# Altium project Pukk-Sensor-Module-v1.0.PrjPcb (part 1 of 6)
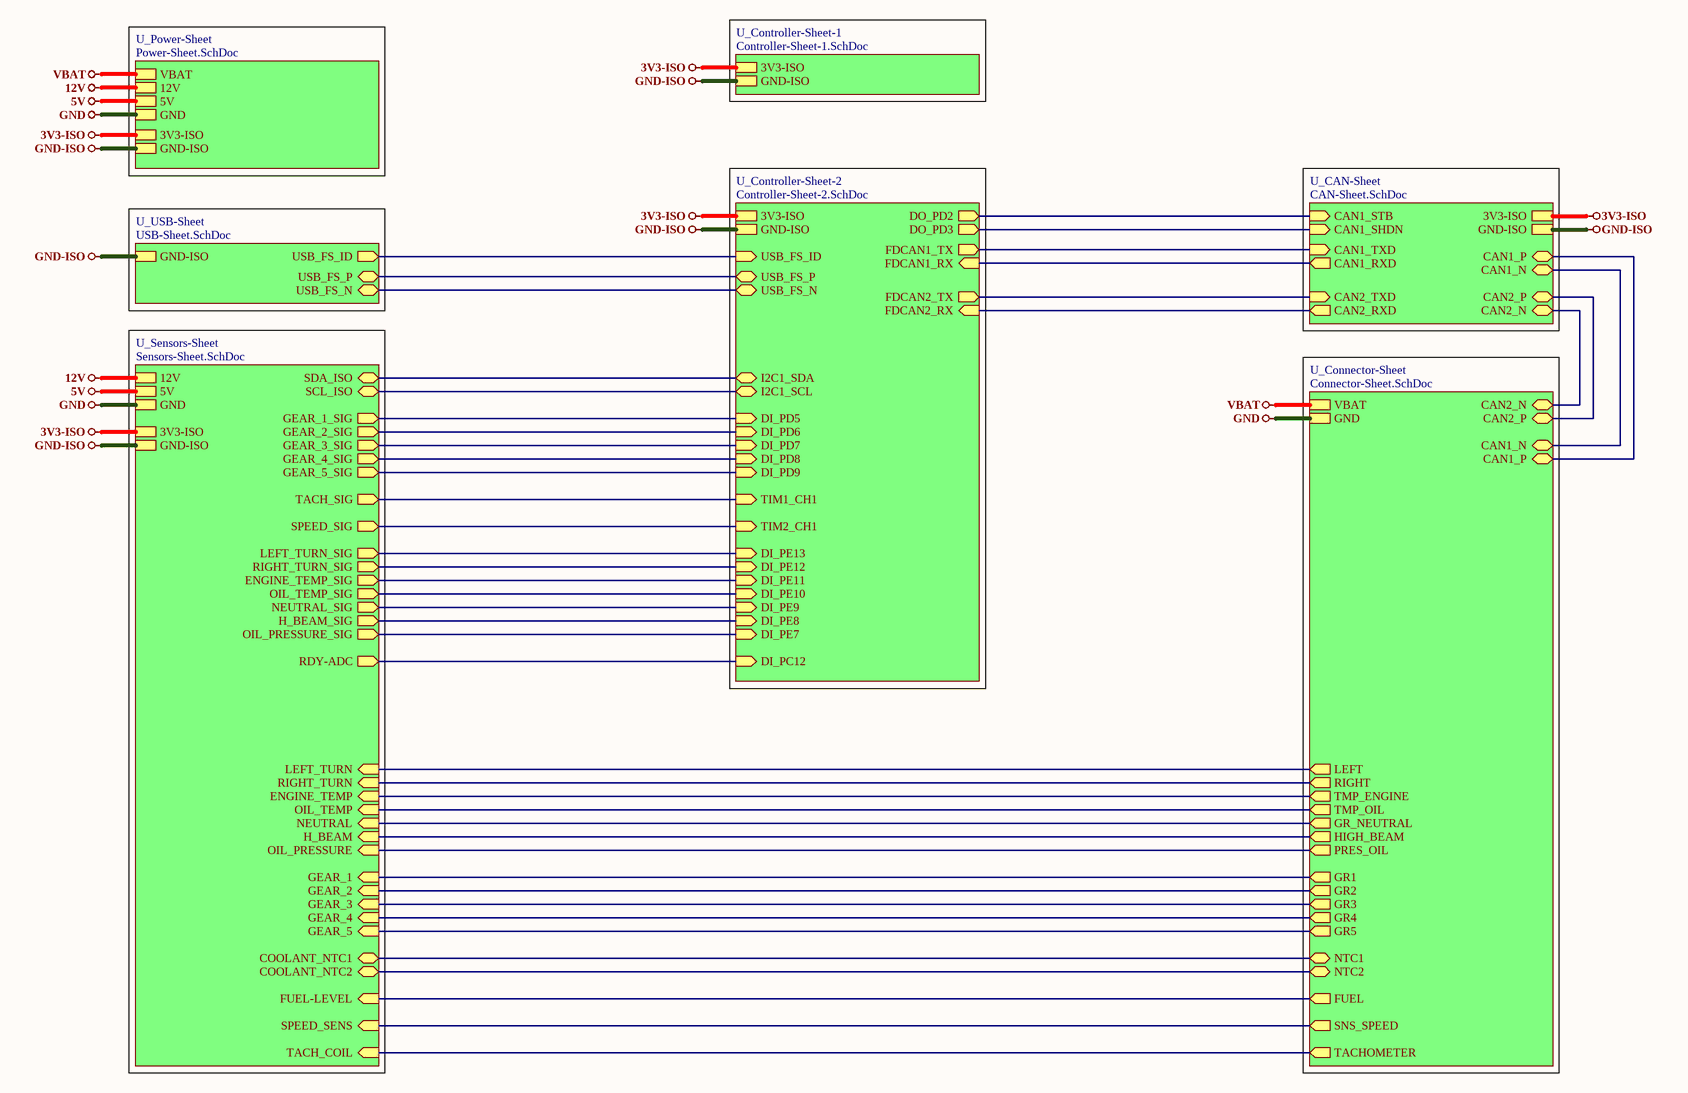
[diagram p0: Top-Sheet.SchDoc]
8 sheets, 261 parts. Net scope: hierarchical (ports join the sheet entries above them; power ports are global).
Board file: Pukk-Sensor-PCB.PcbDoc
Sheets:
  Top-Sheet.SchDoc
    U_Power-Sheet = Power-Sheet.SchDoc
    U_Controller-Sheet-1 = Controller-Sheet-1.SchDoc
    U_Controller-Sheet-2 = Controller-Sheet-2.SchDoc
    U_USB-Sheet = USB-Sheet.SchDoc
    U_CAN-Sheet = CAN-Sheet.SchDoc
    U_Sensors-Sheet = Sensors-Sheet.SchDoc
    U_Connector-Sheet = Connector-Sheet.SchDoc

## Sheet Top-Sheet.SchDoc
size 420 x 297 mm; SheetNumber: 1; SheetTotal: 8

### Sub-sheets
U_CAN-Sheet = CAN-Sheet.SchDoc: CAN1_STB (in), CAN1_TXD (in), CAN1_RXD (out), CAN1_SHDN (in), CAN2_TXD (in), CAN2_RXD (out), 3V3-ISO, GND-ISO, CAN1_P (bidir), CAN1_N (bidir), CAN2_P (bidir), CAN2_N (bidir)
U_Connector-Sheet = Connector-Sheet.SchDoc: GND, VBAT, CAN1_P (bidir), CAN1_N (bidir), CAN2_P (bidir), CAN2_N (bidir), TACHOMETER (out), SNS_SPEED (out), FUEL (out), NTC1 (bidir), NTC2 (bidir), GR1 (out), GR2 (out), GR3 (out), GR4 (out), GR5 (out), LEFT (out), RIGHT (out), TMP_ENGINE (out), TMP_OIL (out), GR_NEUTRAL (out), HIGH_BEAM (out), PRES_OIL (out)
U_Controller-Sheet-1 = Controller-Sheet-1.SchDoc: 3V3-ISO, GND-ISO
U_Controller-Sheet-2 = Controller-Sheet-2.SchDoc: USB_FS_ID (in), USB_FS_N (bidir), USB_FS_P (bidir), FDCAN1_RX (in), FDCAN1_TX (out), FDCAN2_RX (in), FDCAN2_TX (out), DO_PD2 (out), I2C1_SDA (bidir), I2C1_SCL (bidir), DI_PD5 (in), DI_PD6 (in), DI_PD7 (in), DI_PD8 (in), DI_PD9 (in), TIM1_CH1 (in), TIM2_CH1 (in), DI_PC12 (in), DI_PE7 (in), DI_PE8 (in), DI_PE9 (in), DI_PE10 (in), DI_PE11 (in), DI_PE12 (in), DI_PE13 (in), 3V3-ISO, GND-ISO, DO_PD3 (out)
U_Power-Sheet = Power-Sheet.SchDoc: GND, 3V3-ISO, 12V, VBAT, GND-ISO, 5V
U_Sensors-Sheet = Sensors-Sheet.SchDoc: FUEL-LEVEL (in), TACH_COIL (in), TACH_SIG (out), SPEED_SIG (out), SPEED_SENS (in), RDY-ADC (out), LEFT_TURN (in), NEUTRAL (in), RIGHT_TURN (in), H_BEAM (in), OIL_PRESSURE (in), ENGINE_TEMP (in), OIL_TEMP (in), NEUTRAL_SIG (out), LEFT_TURN_SIG (out), RIGHT_TURN_SIG (out), H_BEAM_SIG (out), ENGINE_TEMP_SIG (out), OIL_PRESSURE_SIG (out), OIL_TEMP_SIG (out), GEAR_4 (in), GEAR_5 (in), GEAR_1 (in), GEAR_2 (in), GEAR_3 (in), GEAR_4_SIG (out), GEAR_5_SIG (out), GEAR_1_SIG (out), GEAR_2_SIG (out), GEAR_3_SIG (out), COOLANT_NTC2 (bidir), COOLANT_NTC1 (bidir), GND, 3V3-ISO, 12V, GND-ISO, 5V, SDA_ISO (bidir), SCL_ISO (bidir)
U_USB-Sheet = USB-Sheet.SchDoc: USB_FS_ID (out), USB_FS_N (bidir), USB_FS_P (bidir), GND-ISO

### Nets
3V3-ISO: sheet U_Power-Sheet/3V3-ISO, sheet U_Controller-Sheet-1/3V3-ISO, sheet U_Controller-Sheet-2/3V3-ISO, sheet U_CAN-Sheet/3V3-ISO, sheet U_Sensors-Sheet/3V3-ISO
5V: sheet U_Power-Sheet/5V, sheet U_Sensors-Sheet/5V
12V: sheet U_Power-Sheet/12V, sheet U_Sensors-Sheet/12V
GND: sheet U_Power-Sheet/GND, sheet U_Sensors-Sheet/GND, sheet U_Connector-Sheet/GND
GND-ISO: sheet U_Power-Sheet/GND-ISO, sheet U_Controller-Sheet-1/GND-ISO, sheet U_Controller-Sheet-2/GND-ISO, sheet U_USB-Sheet/GND-ISO, sheet U_CAN-Sheet/GND-ISO, sheet U_Sensors-Sheet/GND-ISO
VBAT: sheet U_Power-Sheet/VBAT, sheet U_Connector-Sheet/VBAT
CAN1_N: sheet U_CAN-Sheet/CAN1_N, sheet U_Connector-Sheet/CAN1_N
CAN1_P: sheet U_CAN-Sheet/CAN1_P, sheet U_Connector-Sheet/CAN1_P
CAN1_RXD: sheet U_Controller-Sheet-2/FDCAN1_RX, sheet U_CAN-Sheet/CAN1_RXD
CAN1_SHDN: sheet U_Controller-Sheet-2/DO_PD3, sheet U_CAN-Sheet/CAN1_SHDN
CAN1_STB: sheet U_Controller-Sheet-2/DO_PD2, sheet U_CAN-Sheet/CAN1_STB
CAN1_TXD: sheet U_Controller-Sheet-2/FDCAN1_TX, sheet U_CAN-Sheet/CAN1_TXD
CAN2_N: sheet U_CAN-Sheet/CAN2_N, sheet U_Connector-Sheet/CAN2_N
CAN2_P: sheet U_CAN-Sheet/CAN2_P, sheet U_Connector-Sheet/CAN2_P
CAN2_RXD: sheet U_Controller-Sheet-2/FDCAN2_RX, sheet U_CAN-Sheet/CAN2_RXD
CAN2_TXD: sheet U_Controller-Sheet-2/FDCAN2_TX, sheet U_CAN-Sheet/CAN2_TXD
COOLANT_NTC1: sheet U_Sensors-Sheet/COOLANT_NTC1, sheet U_Connector-Sheet/NTC1
COOLANT_NTC2: sheet U_Sensors-Sheet/COOLANT_NTC2, sheet U_Connector-Sheet/NTC2
DI_PC12: sheet U_Controller-Sheet-2/DI_PC12, sheet U_Sensors-Sheet/RDY-ADC
DI_PD5: sheet U_Controller-Sheet-2/DI_PD5, sheet U_Sensors-Sheet/GEAR_1_SIG
DI_PD6: sheet U_Controller-Sheet-2/DI_PD6, sheet U_Sensors-Sheet/GEAR_2_SIG
DI_PD7: sheet U_Controller-Sheet-2/DI_PD7, sheet U_Sensors-Sheet/GEAR_3_SIG
DI_PD8: sheet U_Controller-Sheet-2/DI_PD8, sheet U_Sensors-Sheet/GEAR_4_SIG
DI_PD9: sheet U_Controller-Sheet-2/DI_PD9, sheet U_Sensors-Sheet/GEAR_5_SIG
DI_PE7: sheet U_Controller-Sheet-2/DI_PE7, sheet U_Sensors-Sheet/OIL_PRESSURE_SIG
DI_PE8: sheet U_Controller-Sheet-2/DI_PE8, sheet U_Sensors-Sheet/H_BEAM_SIG
DI_PE9: sheet U_Controller-Sheet-2/DI_PE9, sheet U_Sensors-Sheet/NEUTRAL_SIG
DI_PE10: sheet U_Controller-Sheet-2/DI_PE10, sheet U_Sensors-Sheet/OIL_TEMP_SIG
DI_PE11: sheet U_Controller-Sheet-2/DI_PE11, sheet U_Sensors-Sheet/ENGINE_TEMP_SIG
DI_PE12: sheet U_Controller-Sheet-2/DI_PE12, sheet U_Sensors-Sheet/RIGHT_TURN_SIG
DI_PE13: sheet U_Controller-Sheet-2/DI_PE13, sheet U_Sensors-Sheet/LEFT_TURN_SIG
ENGINE_TEMP: sheet U_Sensors-Sheet/ENGINE_TEMP, sheet U_Connector-Sheet/TMP_ENGINE
FUEL: sheet U_Sensors-Sheet/FUEL-LEVEL, sheet U_Connector-Sheet/FUEL
GEAR_1: sheet U_Sensors-Sheet/GEAR_1, sheet U_Connector-Sheet/GR1
GEAR_2: sheet U_Sensors-Sheet/GEAR_2, sheet U_Connector-Sheet/GR2
GEAR_3: sheet U_Sensors-Sheet/GEAR_3, sheet U_Connector-Sheet/GR3
GEAR_4: sheet U_Sensors-Sheet/GEAR_4, sheet U_Connector-Sheet/GR4
GEAR_5: sheet U_Sensors-Sheet/GEAR_5, sheet U_Connector-Sheet/GR5
GR_NEUTRAL: sheet U_Sensors-Sheet/NEUTRAL, sheet U_Connector-Sheet/GR_NEUTRAL
H_BEAM: sheet U_Sensors-Sheet/H_BEAM, sheet U_Connector-Sheet/HIGH_BEAM
I2C1_SCL: sheet U_Controller-Sheet-2/I2C1_SCL, sheet U_Sensors-Sheet/SCL_ISO
I2C1_SDA: sheet U_Controller-Sheet-2/I2C1_SDA, sheet U_Sensors-Sheet/SDA_ISO
LEFT: sheet U_Sensors-Sheet/LEFT_TURN, sheet U_Connector-Sheet/LEFT
OIL_PRESSURE: sheet U_Sensors-Sheet/OIL_PRESSURE, sheet U_Connector-Sheet/PRES_OIL
OIL_TEMP: sheet U_Sensors-Sheet/OIL_TEMP, sheet U_Connector-Sheet/TMP_OIL
RIGHT: sheet U_Sensors-Sheet/RIGHT_TURN, sheet U_Connector-Sheet/RIGHT
SNS_SPEED: sheet U_Sensors-Sheet/SPEED_SENS, sheet U_Connector-Sheet/SNS_SPEED
SPEED_SIG: sheet U_Controller-Sheet-2/TIM2_CH1, sheet U_Sensors-Sheet/SPEED_SIG
TACH_COIL: sheet U_Sensors-Sheet/TACH_COIL, sheet U_Connector-Sheet/TACHOMETER
TACH_SIG: sheet U_Controller-Sheet-2/TIM1_CH1, sheet U_Sensors-Sheet/TACH_SIG
USB_FS_ID: sheet U_Controller-Sheet-2/USB_FS_ID, sheet U_USB-Sheet/USB_FS_ID
USB_FS_N: sheet U_Controller-Sheet-2/USB_FS_N, sheet U_USB-Sheet/USB_FS_N
USB_FS_P: sheet U_Controller-Sheet-2/USB_FS_P, sheet U_USB-Sheet/USB_FS_P

### Notes on the sheet
- File:
- Title:
- Date:
- Page
- Num:
- Total:
- Drawn By: Huzaifa Ali